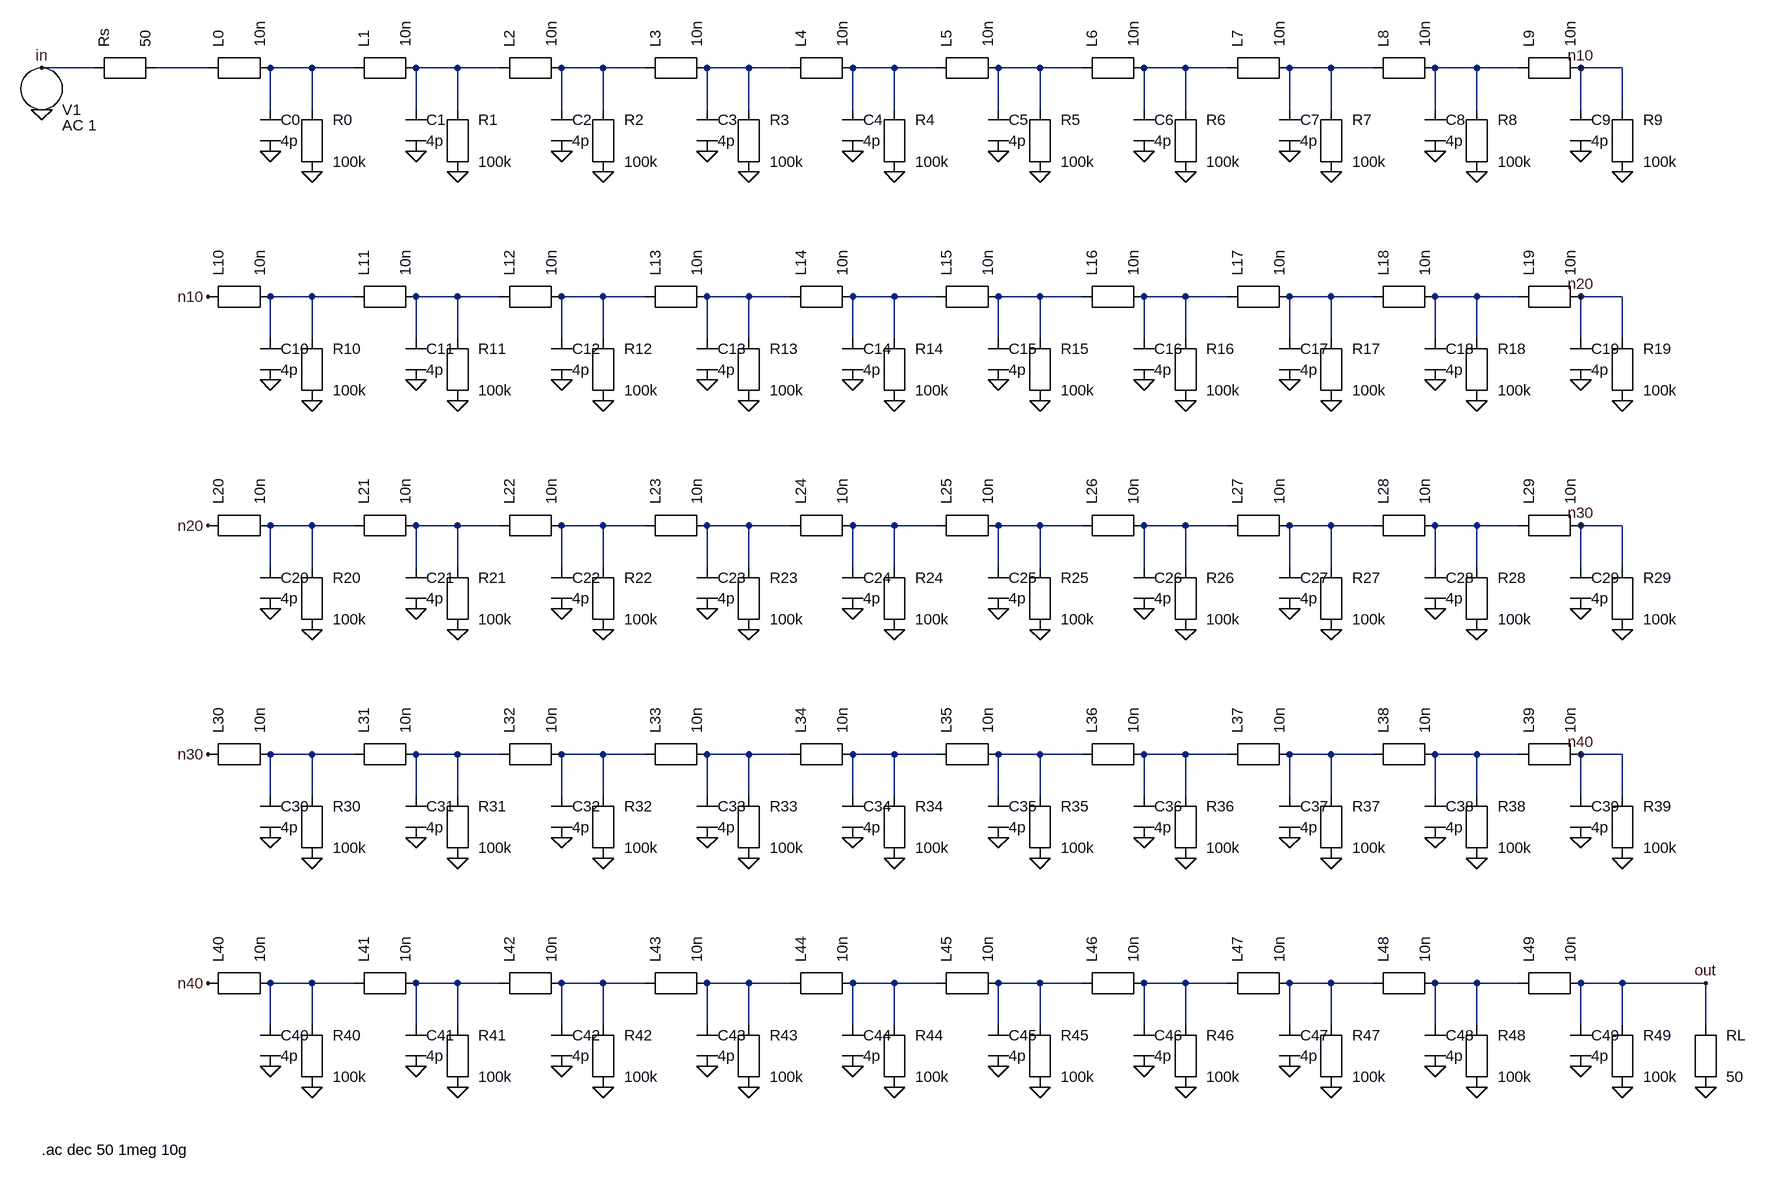
[diagram p0: schematic rlc_line_drawn.asc]
rlc_line_drawn.asc, the LTspice schematic file:
Version 4
SHEET 1 880 680
WIRE 96 96 176 96
WIRE 272 96 352 96
WIRE 448 96 576 96
WIRE 672 96 800 96
WIRE 896 96 1024 96
WIRE 1120 96 1248 96
WIRE 1344 96 1472 96
WIRE 1568 96 1696 96
WIRE 1792 96 1920 96
WIRE 2016 96 2144 96
WIRE 2240 96 2368 96
WIRE 448 448 576 448
WIRE 672 448 800 448
WIRE 896 448 1024 448
WIRE 1120 448 1248 448
WIRE 1344 448 1472 448
WIRE 1568 448 1696 448
WIRE 1792 448 1920 448
WIRE 2016 448 2144 448
WIRE 2240 448 2368 448
WIRE 448 800 576 800
WIRE 672 800 800 800
WIRE 896 800 1024 800
WIRE 1120 800 1248 800
WIRE 1344 800 1472 800
WIRE 1568 800 1696 800
WIRE 1792 800 1920 800
WIRE 2016 800 2144 800
WIRE 2240 800 2368 800
WIRE 448 1152 576 1152
WIRE 672 1152 800 1152
WIRE 896 1152 1024 1152
WIRE 1120 1152 1248 1152
WIRE 1344 1152 1472 1152
WIRE 1568 1152 1696 1152
WIRE 1792 1152 1920 1152
WIRE 2016 1152 2144 1152
WIRE 2240 1152 2368 1152
WIRE 448 1504 576 1504
WIRE 672 1504 800 1504
WIRE 896 1504 1024 1504
WIRE 1120 1504 1248 1504
WIRE 1344 1504 1472 1504
WIRE 1568 1504 1696 1504
WIRE 1792 1504 1920 1504
WIRE 2016 1504 2144 1504
WIRE 2240 1504 2368 1504
WIRE 448 160 448 96
WIRE 512 160 512 96
WIRE 672 160 672 96
WIRE 736 160 736 96
WIRE 896 160 896 96
WIRE 960 160 960 96
WIRE 1120 160 1120 96
WIRE 1184 160 1184 96
WIRE 1344 160 1344 96
WIRE 1408 160 1408 96
WIRE 1568 160 1568 96
WIRE 1632 160 1632 96
WIRE 1792 160 1792 96
WIRE 1856 160 1856 96
WIRE 2016 160 2016 96
WIRE 2080 160 2080 96
WIRE 2240 160 2240 96
WIRE 2304 160 2304 96
WIRE 2464 160 2464 96
WIRE 2528 160 2528 96
WIRE 2528 96 2464 96
WIRE 448 512 448 448
WIRE 512 512 512 448
WIRE 672 512 672 448
WIRE 736 512 736 448
WIRE 896 512 896 448
WIRE 960 512 960 448
WIRE 1120 512 1120 448
WIRE 1184 512 1184 448
WIRE 1344 512 1344 448
WIRE 1408 512 1408 448
WIRE 1568 512 1568 448
WIRE 1632 512 1632 448
WIRE 1792 512 1792 448
WIRE 1856 512 1856 448
WIRE 2016 512 2016 448
WIRE 2080 512 2080 448
WIRE 2240 512 2240 448
WIRE 2304 512 2304 448
WIRE 2464 512 2464 448
WIRE 2528 512 2528 448
WIRE 2528 448 2464 448
WIRE 448 864 448 800
WIRE 512 864 512 800
WIRE 672 864 672 800
WIRE 736 864 736 800
WIRE 896 864 896 800
WIRE 960 864 960 800
WIRE 1120 864 1120 800
WIRE 1184 864 1184 800
WIRE 1344 864 1344 800
WIRE 1408 864 1408 800
WIRE 1568 864 1568 800
WIRE 1632 864 1632 800
WIRE 1792 864 1792 800
WIRE 1856 864 1856 800
WIRE 2016 864 2016 800
WIRE 2080 864 2080 800
WIRE 2240 864 2240 800
WIRE 2304 864 2304 800
WIRE 2464 864 2464 800
WIRE 2528 864 2528 800
WIRE 2528 800 2464 800
WIRE 448 1216 448 1152
WIRE 512 1216 512 1152
WIRE 672 1216 672 1152
WIRE 736 1216 736 1152
WIRE 896 1216 896 1152
WIRE 960 1216 960 1152
WIRE 1120 1216 1120 1152
WIRE 1184 1216 1184 1152
WIRE 1344 1216 1344 1152
WIRE 1408 1216 1408 1152
WIRE 1568 1216 1568 1152
WIRE 1632 1216 1632 1152
WIRE 1792 1216 1792 1152
WIRE 1856 1216 1856 1152
WIRE 2016 1216 2016 1152
WIRE 2080 1216 2080 1152
WIRE 2240 1216 2240 1152
WIRE 2304 1216 2304 1152
WIRE 2464 1216 2464 1152
WIRE 2528 1216 2528 1152
WIRE 2528 1152 2464 1152
WIRE 448 1568 448 1504
WIRE 512 1568 512 1504
WIRE 672 1568 672 1504
WIRE 736 1568 736 1504
WIRE 896 1568 896 1504
WIRE 960 1568 960 1504
WIRE 1120 1568 1120 1504
WIRE 1184 1568 1184 1504
WIRE 1344 1568 1344 1504
WIRE 1408 1568 1408 1504
WIRE 1568 1568 1568 1504
WIRE 1632 1568 1632 1504
WIRE 1792 1568 1792 1504
WIRE 1856 1568 1856 1504
WIRE 2016 1568 2016 1504
WIRE 2080 1568 2080 1504
WIRE 2240 1568 2240 1504
WIRE 2304 1568 2304 1504
WIRE 2464 1568 2464 1504
WIRE 2464 1504 2656 1504
WIRE 2656 1504 2656 1568
WIRE 2528 1568 2528 1504
FLAG 96 96 in
FLAG 96 160 0
FLAG 352 448 n10
FLAG 352 800 n20
FLAG 352 1152 n30
FLAG 352 1504 n40
FLAG 448 224 0
FLAG 512 256 0
FLAG 672 224 0
FLAG 736 256 0
FLAG 896 224 0
FLAG 960 256 0
FLAG 1120 224 0
FLAG 1184 256 0
FLAG 1344 224 0
FLAG 1408 256 0
FLAG 1568 224 0
FLAG 1632 256 0
FLAG 1792 224 0
FLAG 1856 256 0
FLAG 2016 224 0
FLAG 2080 256 0
FLAG 2240 224 0
FLAG 2304 256 0
FLAG 2464 96 n10
FLAG 2464 224 0
FLAG 2528 256 0
FLAG 448 576 0
FLAG 512 608 0
FLAG 672 576 0
FLAG 736 608 0
FLAG 896 576 0
FLAG 960 608 0
FLAG 1120 576 0
FLAG 1184 608 0
FLAG 1344 576 0
FLAG 1408 608 0
FLAG 1568 576 0
FLAG 1632 608 0
FLAG 1792 576 0
FLAG 1856 608 0
FLAG 2016 576 0
FLAG 2080 608 0
FLAG 2240 576 0
FLAG 2304 608 0
FLAG 2464 448 n20
FLAG 2464 576 0
FLAG 2528 608 0
FLAG 448 928 0
FLAG 512 960 0
FLAG 672 928 0
FLAG 736 960 0
FLAG 896 928 0
FLAG 960 960 0
FLAG 1120 928 0
FLAG 1184 960 0
FLAG 1344 928 0
FLAG 1408 960 0
FLAG 1568 928 0
FLAG 1632 960 0
FLAG 1792 928 0
FLAG 1856 960 0
FLAG 2016 928 0
FLAG 2080 960 0
FLAG 2240 928 0
FLAG 2304 960 0
FLAG 2464 800 n30
FLAG 2464 928 0
FLAG 2528 960 0
FLAG 448 1280 0
FLAG 512 1312 0
FLAG 672 1280 0
FLAG 736 1312 0
FLAG 896 1280 0
FLAG 960 1312 0
FLAG 1120 1280 0
FLAG 1184 1312 0
FLAG 1344 1280 0
FLAG 1408 1312 0
FLAG 1568 1280 0
FLAG 1632 1312 0
FLAG 1792 1280 0
FLAG 1856 1312 0
FLAG 2016 1280 0
FLAG 2080 1312 0
FLAG 2240 1280 0
FLAG 2304 1312 0
FLAG 2464 1152 n40
FLAG 2464 1280 0
FLAG 2528 1312 0
FLAG 448 1632 0
FLAG 512 1664 0
FLAG 672 1632 0
FLAG 736 1664 0
FLAG 896 1632 0
FLAG 960 1664 0
FLAG 1120 1632 0
FLAG 1184 1664 0
FLAG 1344 1632 0
FLAG 1408 1664 0
FLAG 1568 1632 0
FLAG 1632 1664 0
FLAG 1792 1632 0
FLAG 1856 1664 0
FLAG 2016 1632 0
FLAG 2080 1664 0
FLAG 2240 1632 0
FLAG 2304 1664 0
FLAG 2656 1504 out
FLAG 2656 1664 0
FLAG 2464 1632 0
FLAG 2528 1664 0
SYMBOL voltage 96 128 R0
SYMATTR InstName V1
SYMATTR Value AC 1
SYMBOL res 224 96 R270
SYMATTR InstName Rs
SYMATTR Value 50
SYMBOL ind 400 96 R270
SYMATTR InstName L0
SYMATTR Value 10n
SYMBOL ind 624 96 R270
SYMATTR InstName L1
SYMATTR Value 10n
SYMBOL ind 848 96 R270
SYMATTR InstName L2
SYMATTR Value 10n
SYMBOL ind 1072 96 R270
SYMATTR InstName L3
SYMATTR Value 10n
SYMBOL ind 1296 96 R270
SYMATTR InstName L4
SYMATTR Value 10n
SYMBOL ind 1520 96 R270
SYMATTR InstName L5
SYMATTR Value 10n
SYMBOL ind 1744 96 R270
SYMATTR InstName L6
SYMATTR Value 10n
SYMBOL ind 1968 96 R270
SYMATTR InstName L7
SYMATTR Value 10n
SYMBOL ind 2192 96 R270
SYMATTR InstName L8
SYMATTR Value 10n
SYMBOL ind 2416 96 R270
SYMATTR InstName L9
SYMATTR Value 10n
SYMBOL ind 400 448 R270
SYMATTR InstName L10
SYMATTR Value 10n
SYMBOL ind 624 448 R270
SYMATTR InstName L11
SYMATTR Value 10n
SYMBOL ind 848 448 R270
SYMATTR InstName L12
SYMATTR Value 10n
SYMBOL ind 1072 448 R270
SYMATTR InstName L13
SYMATTR Value 10n
SYMBOL ind 1296 448 R270
SYMATTR InstName L14
SYMATTR Value 10n
SYMBOL ind 1520 448 R270
SYMATTR InstName L15
SYMATTR Value 10n
SYMBOL ind 1744 448 R270
SYMATTR InstName L16
SYMATTR Value 10n
SYMBOL ind 1968 448 R270
SYMATTR InstName L17
SYMATTR Value 10n
SYMBOL ind 2192 448 R270
SYMATTR InstName L18
SYMATTR Value 10n
SYMBOL ind 2416 448 R270
SYMATTR InstName L19
SYMATTR Value 10n
SYMBOL ind 400 800 R270
SYMATTR InstName L20
SYMATTR Value 10n
SYMBOL ind 624 800 R270
SYMATTR InstName L21
SYMATTR Value 10n
SYMBOL ind 848 800 R270
SYMATTR InstName L22
SYMATTR Value 10n
SYMBOL ind 1072 800 R270
SYMATTR InstName L23
SYMATTR Value 10n
SYMBOL ind 1296 800 R270
SYMATTR InstName L24
SYMATTR Value 10n
SYMBOL ind 1520 800 R270
SYMATTR InstName L25
SYMATTR Value 10n
SYMBOL ind 1744 800 R270
SYMATTR InstName L26
SYMATTR Value 10n
SYMBOL ind 1968 800 R270
SYMATTR InstName L27
SYMATTR Value 10n
SYMBOL ind 2192 800 R270
SYMATTR InstName L28
SYMATTR Value 10n
SYMBOL ind 2416 800 R270
SYMATTR InstName L29
SYMATTR Value 10n
SYMBOL ind 400 1152 R270
SYMATTR InstName L30
SYMATTR Value 10n
SYMBOL ind 624 1152 R270
SYMATTR InstName L31
SYMATTR Value 10n
SYMBOL ind 848 1152 R270
SYMATTR InstName L32
SYMATTR Value 10n
SYMBOL ind 1072 1152 R270
SYMATTR InstName L33
SYMATTR Value 10n
SYMBOL ind 1296 1152 R270
SYMATTR InstName L34
SYMATTR Value 10n
SYMBOL ind 1520 1152 R270
SYMATTR InstName L35
SYMATTR Value 10n
SYMBOL ind 1744 1152 R270
SYMATTR InstName L36
SYMATTR Value 10n
SYMBOL ind 1968 1152 R270
SYMATTR InstName L37
SYMATTR Value 10n
SYMBOL ind 2192 1152 R270
SYMATTR InstName L38
SYMATTR Value 10n
SYMBOL ind 2416 1152 R270
SYMATTR InstName L39
SYMATTR Value 10n
SYMBOL ind 400 1504 R270
SYMATTR InstName L40
SYMATTR Value 10n
SYMBOL ind 624 1504 R270
SYMATTR InstName L41
SYMATTR Value 10n
SYMBOL ind 848 1504 R270
SYMATTR InstName L42
SYMATTR Value 10n
SYMBOL ind 1072 1504 R270
SYMATTR InstName L43
SYMATTR Value 10n
SYMBOL ind 1296 1504 R270
SYMATTR InstName L44
SYMATTR Value 10n
SYMBOL ind 1520 1504 R270
SYMATTR InstName L45
SYMATTR Value 10n
SYMBOL ind 1744 1504 R270
SYMATTR InstName L46
SYMATTR Value 10n
SYMBOL ind 1968 1504 R270
SYMATTR InstName L47
SYMATTR Value 10n
SYMBOL ind 2192 1504 R270
SYMATTR InstName L48
SYMATTR Value 10n
SYMBOL ind 2416 1504 R270
SYMATTR InstName L49
SYMATTR Value 10n
SYMBOL cap 448 192 R0
SYMATTR InstName C0
SYMATTR Value 4p
SYMBOL res 512 208 R0
SYMATTR InstName R0
SYMATTR Value 100k
SYMBOL cap 672 192 R0
SYMATTR InstName C1
SYMATTR Value 4p
SYMBOL res 736 208 R0
SYMATTR InstName R1
SYMATTR Value 100k
SYMBOL cap 896 192 R0
SYMATTR InstName C2
SYMATTR Value 4p
SYMBOL res 960 208 R0
SYMATTR InstName R2
SYMATTR Value 100k
SYMBOL cap 1120 192 R0
SYMATTR InstName C3
SYMATTR Value 4p
SYMBOL res 1184 208 R0
SYMATTR InstName R3
SYMATTR Value 100k
SYMBOL cap 1344 192 R0
SYMATTR InstName C4
SYMATTR Value 4p
SYMBOL res 1408 208 R0
SYMATTR InstName R4
SYMATTR Value 100k
SYMBOL cap 1568 192 R0
SYMATTR InstName C5
SYMATTR Value 4p
SYMBOL res 1632 208 R0
SYMATTR InstName R5
SYMATTR Value 100k
SYMBOL cap 1792 192 R0
SYMATTR InstName C6
SYMATTR Value 4p
SYMBOL res 1856 208 R0
SYMATTR InstName R6
SYMATTR Value 100k
SYMBOL cap 2016 192 R0
SYMATTR InstName C7
SYMATTR Value 4p
SYMBOL res 2080 208 R0
SYMATTR InstName R7
SYMATTR Value 100k
SYMBOL cap 2240 192 R0
SYMATTR InstName C8
SYMATTR Value 4p
SYMBOL res 2304 208 R0
SYMATTR InstName R8
SYMATTR Value 100k
SYMBOL cap 2464 192 R0
SYMATTR InstName C9
SYMATTR Value 4p
SYMBOL res 2528 208 R0
SYMATTR InstName R9
SYMATTR Value 100k
SYMBOL cap 448 544 R0
SYMATTR InstName C10
SYMATTR Value 4p
SYMBOL res 512 560 R0
SYMATTR InstName R10
SYMATTR Value 100k
SYMBOL cap 672 544 R0
SYMATTR InstName C11
SYMATTR Value 4p
SYMBOL res 736 560 R0
SYMATTR InstName R11
SYMATTR Value 100k
SYMBOL cap 896 544 R0
SYMATTR InstName C12
SYMATTR Value 4p
SYMBOL res 960 560 R0
SYMATTR InstName R12
SYMATTR Value 100k
SYMBOL cap 1120 544 R0
SYMATTR InstName C13
SYMATTR Value 4p
SYMBOL res 1184 560 R0
SYMATTR InstName R13
SYMATTR Value 100k
SYMBOL cap 1344 544 R0
SYMATTR InstName C14
SYMATTR Value 4p
SYMBOL res 1408 560 R0
SYMATTR InstName R14
SYMATTR Value 100k
SYMBOL cap 1568 544 R0
SYMATTR InstName C15
SYMATTR Value 4p
SYMBOL res 1632 560 R0
SYMATTR InstName R15
SYMATTR Value 100k
SYMBOL cap 1792 544 R0
SYMATTR InstName C16
SYMATTR Value 4p
SYMBOL res 1856 560 R0
SYMATTR InstName R16
SYMATTR Value 100k
SYMBOL cap 2016 544 R0
SYMATTR InstName C17
SYMATTR Value 4p
SYMBOL res 2080 560 R0
SYMATTR InstName R17
SYMATTR Value 100k
SYMBOL cap 2240 544 R0
SYMATTR InstName C18
SYMATTR Value 4p
SYMBOL res 2304 560 R0
SYMATTR InstName R18
SYMATTR Value 100k
SYMBOL cap 2464 544 R0
SYMATTR InstName C19
SYMATTR Value 4p
SYMBOL res 2528 560 R0
SYMATTR InstName R19
SYMATTR Value 100k
SYMBOL cap 448 896 R0
SYMATTR InstName C20
SYMATTR Value 4p
SYMBOL res 512 912 R0
SYMATTR InstName R20
SYMATTR Value 100k
SYMBOL cap 672 896 R0
SYMATTR InstName C21
SYMATTR Value 4p
SYMBOL res 736 912 R0
SYMATTR InstName R21
SYMATTR Value 100k
SYMBOL cap 896 896 R0
SYMATTR InstName C22
SYMATTR Value 4p
SYMBOL res 960 912 R0
SYMATTR InstName R22
SYMATTR Value 100k
SYMBOL cap 1120 896 R0
SYMATTR InstName C23
SYMATTR Value 4p
SYMBOL res 1184 912 R0
SYMATTR InstName R23
SYMATTR Value 100k
SYMBOL cap 1344 896 R0
SYMATTR InstName C24
SYMATTR Value 4p
SYMBOL res 1408 912 R0
SYMATTR InstName R24
SYMATTR Value 100k
SYMBOL cap 1568 896 R0
SYMATTR InstName C25
SYMATTR Value 4p
SYMBOL res 1632 912 R0
SYMATTR InstName R25
SYMATTR Value 100k
SYMBOL cap 1792 896 R0
SYMATTR InstName C26
SYMATTR Value 4p
SYMBOL res 1856 912 R0
SYMATTR InstName R26
SYMATTR Value 100k
SYMBOL cap 2016 896 R0
SYMATTR InstName C27
SYMATTR Value 4p
SYMBOL res 2080 912 R0
SYMATTR InstName R27
SYMATTR Value 100k
SYMBOL cap 2240 896 R0
SYMATTR InstName C28
SYMATTR Value 4p
SYMBOL res 2304 912 R0
SYMATTR InstName R28
SYMATTR Value 100k
SYMBOL cap 2464 896 R0
SYMATTR InstName C29
SYMATTR Value 4p
SYMBOL res 2528 912 R0
SYMATTR InstName R29
SYMATTR Value 100k
SYMBOL cap 448 1248 R0
SYMATTR InstName C30
SYMATTR Value 4p
SYMBOL res 512 1264 R0
SYMATTR InstName R30
SYMATTR Value 100k
SYMBOL cap 672 1248 R0
SYMATTR InstName C31
SYMATTR Value 4p
SYMBOL res 736 1264 R0
SYMATTR InstName R31
SYMATTR Value 100k
SYMBOL cap 896 1248 R0
SYMATTR InstName C32
SYMATTR Value 4p
SYMBOL res 960 1264 R0
SYMATTR InstName R32
SYMATTR Value 100k
SYMBOL cap 1120 1248 R0
SYMATTR InstName C33
SYMATTR Value 4p
SYMBOL res 1184 1264 R0
SYMATTR InstName R33
SYMATTR Value 100k
SYMBOL cap 1344 1248 R0
SYMATTR InstName C34
SYMATTR Value 4p
SYMBOL res 1408 1264 R0
SYMATTR InstName R34
SYMATTR Value 100k
SYMBOL cap 1568 1248 R0
SYMATTR InstName C35
SYMATTR Value 4p
SYMBOL res 1632 1264 R0
SYMATTR InstName R35
SYMATTR Value 100k
SYMBOL cap 1792 1248 R0
SYMATTR InstName C36
SYMATTR Value 4p
SYMBOL res 1856 1264 R0
SYMATTR InstName R36
SYMATTR Value 100k
SYMBOL cap 2016 1248 R0
SYMATTR InstName C37
SYMATTR Value 4p
SYMBOL res 2080 1264 R0
SYMATTR InstName R37
SYMATTR Value 100k
SYMBOL cap 2240 1248 R0
SYMATTR InstName C38
SYMATTR Value 4p
SYMBOL res 2304 1264 R0
SYMATTR InstName R38
SYMATTR Value 100k
SYMBOL cap 2464 1248 R0
SYMATTR InstName C39
SYMATTR Value 4p
SYMBOL res 2528 1264 R0
SYMATTR InstName R39
SYMATTR Value 100k
SYMBOL cap 448 1600 R0
SYMATTR InstName C40
SYMATTR Value 4p
SYMBOL res 512 1616 R0
SYMATTR InstName R40
SYMATTR Value 100k
SYMBOL cap 672 1600 R0
SYMATTR InstName C41
SYMATTR Value 4p
SYMBOL res 736 1616 R0
SYMATTR InstName R41
SYMATTR Value 100k
SYMBOL cap 896 1600 R0
SYMATTR InstName C42
SYMATTR Value 4p
SYMBOL res 960 1616 R0
SYMATTR InstName R42
SYMATTR Value 100k
SYMBOL cap 1120 1600 R0
SYMATTR InstName C43
SYMATTR Value 4p
SYMBOL res 1184 1616 R0
SYMATTR InstName R43
SYMATTR Value 100k
SYMBOL cap 1344 1600 R0
SYMATTR InstName C44
SYMATTR Value 4p
SYMBOL res 1408 1616 R0
SYMATTR InstName R44
SYMATTR Value 100k
SYMBOL cap 1568 1600 R0
SYMATTR InstName C45
SYMATTR Value 4p
SYMBOL res 1632 1616 R0
SYMATTR InstName R45
SYMATTR Value 100k
SYMBOL cap 1792 1600 R0
SYMATTR InstName C46
SYMATTR Value 4p
SYMBOL res 1856 1616 R0
SYMATTR InstName R46
SYMATTR Value 100k
SYMBOL cap 2016 1600 R0
SYMATTR InstName C47
SYMATTR Value 4p
SYMBOL res 2080 1616 R0
SYMATTR InstName R47
SYMATTR Value 100k
SYMBOL cap 2240 1600 R0
SYMATTR InstName C48
SYMATTR Value 4p
SYMBOL res 2304 1616 R0
SYMATTR InstName R48
SYMATTR Value 100k
SYMBOL cap 2464 1600 R0
SYMATTR InstName C49
SYMATTR Value 4p
SYMBOL res 2528 1616 R0
SYMATTR InstName R49
SYMATTR Value 100k
SYMBOL res 2656 1616 R0
SYMATTR InstName RL
SYMATTR Value 50
TEXT 96 1760 Left 2 !.ac dec 50 1meg 10g

The netlist it stands for:
* rlc_line_drawn.asc
V1 in 0 AC 1
Rs in N001 50
L0 N001 N002 10n
L1 N002 N003 10n
L2 N003 N004 10n
L3 N004 N005 10n
L4 N005 N006 10n
L5 N006 N007 10n
L6 N007 N008 10n
L7 N008 N009 10n
L8 N009 N010 10n
L9 N010 n10 10n
L10 n10 N011 10n
L11 N011 N012 10n
L12 N012 N013 10n
L13 N013 N014 10n
L14 N014 N015 10n
L15 N015 N016 10n
L16 N016 N017 10n
L17 N017 N018 10n
L18 N018 N019 10n
L19 N019 n20 10n
L20 n20 N020 10n
L21 N020 N021 10n
L22 N021 N022 10n
L23 N022 N023 10n
L24 N023 N024 10n
L25 N024 N025 10n
L26 N025 N026 10n
L27 N026 N027 10n
L28 N027 N028 10n
L29 N028 n30 10n
L30 n30 N029 10n
L31 N029 N030 10n
L32 N030 N031 10n
L33 N031 N032 10n
L34 N032 N033 10n
L35 N033 N034 10n
L36 N034 N035 10n
L37 N035 N036 10n
L38 N036 N037 10n
L39 N037 n40 10n
L40 n40 N038 10n
L41 N038 N039 10n
L42 N039 N040 10n
L43 N040 N041 10n
L44 N041 N042 10n
L45 N042 N043 10n
L46 N043 N044 10n
L47 N044 N045 10n
L48 N045 N046 10n
L49 N046 out 10n
C0 N002 0 4p
R0 N002 0 100k
C1 N003 0 4p
R1 N003 0 100k
C2 N004 0 4p
R2 N004 0 100k
C3 N005 0 4p
R3 N005 0 100k
C4 N006 0 4p
R4 N006 0 100k
C5 N007 0 4p
R5 N007 0 100k
C6 N008 0 4p
R6 N008 0 100k
C7 N009 0 4p
R7 N009 0 100k
C8 N010 0 4p
R8 N010 0 100k
C9 n10 0 4p
R9 n10 0 100k
C10 N011 0 4p
R10 N011 0 100k
C11 N012 0 4p
R11 N012 0 100k
C12 N013 0 4p
R12 N013 0 100k
C13 N014 0 4p
R13 N014 0 100k
C14 N015 0 4p
R14 N015 0 100k
C15 N016 0 4p
R15 N016 0 100k
C16 N017 0 4p
R16 N017 0 100k
C17 N018 0 4p
R17 N018 0 100k
C18 N019 0 4p
R18 N019 0 100k
C19 n20 0 4p
R19 n20 0 100k
C20 N020 0 4p
R20 N020 0 100k
C21 N021 0 4p
R21 N021 0 100k
C22 N022 0 4p
R22 N022 0 100k
C23 N023 0 4p
R23 N023 0 100k
C24 N024 0 4p
R24 N024 0 100k
C25 N025 0 4p
R25 N025 0 100k
C26 N026 0 4p
R26 N026 0 100k
C27 N027 0 4p
R27 N027 0 100k
C28 N028 0 4p
R28 N028 0 100k
C29 n30 0 4p
R29 n30 0 100k
C30 N029 0 4p
R30 N029 0 100k
C31 N030 0 4p
R31 N030 0 100k
C32 N031 0 4p
R32 N031 0 100k
C33 N032 0 4p
R33 N032 0 100k
C34 N033 0 4p
R34 N033 0 100k
C35 N034 0 4p
R35 N034 0 100k
C36 N035 0 4p
R36 N035 0 100k
C37 N036 0 4p
R37 N036 0 100k
C38 N037 0 4p
R38 N037 0 100k
C39 n40 0 4p
R39 n40 0 100k
C40 N038 0 4p
R40 N038 0 100k
C41 N039 0 4p
R41 N039 0 100k
C42 N040 0 4p
R42 N040 0 100k
C43 N041 0 4p
R43 N041 0 100k
C44 N042 0 4p
R44 N042 0 100k
C45 N043 0 4p
R45 N043 0 100k
C46 N044 0 4p
R46 N044 0 100k
C47 N045 0 4p
R47 N045 0 100k
C48 N046 0 4p
R48 N046 0 100k
C49 out 0 4p
R49 out 0 100k
RL out 0 50
.ac dec 50 1meg 10g
.backanno
.end